# Altium schematic sheet Power.SchDoc
size Letter; SheetNumber: 3; SheetTotal: 7
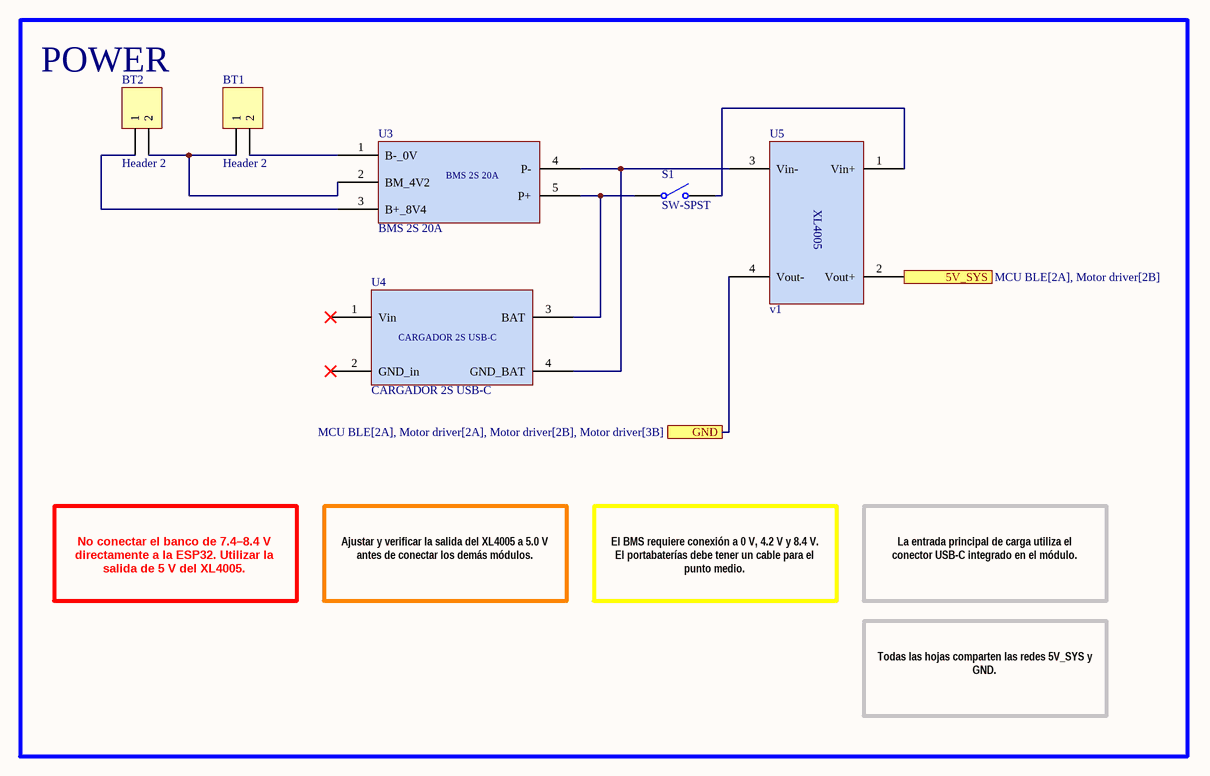
[diagram p0: Power.SchDoc]

## Parts
BT1  Header 2  [BORNERAS]
BT2  Header 2  [BORNERAS]
S1  SW-SPST  [BORNERAS]
U3  BMS 2S 20A  [BMS_2S_20A_HW391]
U4  CARGADOR 2S USB-C  [CARGADOR_2S_USBC]
U5  v1  [XL4005_MODULE]

## Blocks framed on the sheet
POWER: BT1 BT2 S1 U3-U5

## Ports
5V_SYS (see MCU BLE[2A], Motor driver[2B]), GND (see MCU BLE[2A], Motor driver[2A], Motor driver[2B], Motor driver[3B])

## Nets
5V_SYS: U5.2(Vout+) ; port 5V_SYS
GND: U5.4(Vout-) ; port GND
NetBT1_1: BT1.1 BT2.2 U3.2(BM_4V2)
NetBT1_2: BT1.2 U3.1(B-_0V)
NetBT2_1: BT2.1 U3.3(B+_8V4)
NetS1_1: S1.1(COMMON) U3.5(P+) U4.3(BAT)
NetS1_2: S1.2(NO) U5.1(Vin+)
NetU3_4: U3.4(P-) U4.4(GND_BAT) U5.3(Vin-)

Not connected (* = marked no-connect by the designer): U4 1(Vin)* 2(GND_in)*

## Notes on the sheet
- No conectar el banco de 7.4–8.4 V directamente a la ESP32. Utilizar la salida de 5 V del XL4005.
- Ajustar y verificar la salida del XL4005 a 5.0 V antes de conectar los demás módulos.
- El BMS requiere conexión a 0 V, 4.2 V y 8.4 V. El portabaterías debe tener un cable para el punto medio.
- La entrada principal de carga utiliza el conector USB-C integrado en el módulo.
- Todas las hojas comparten las redes 5V_SYS y GND.
- Proyecto:
- Autor:
- Carné:
- Documento:
- Curso:
- Revision:
- Fecha:
- Tamaño:
- Carta
- Hoja:      de
- (in symbol XL4005_MODULE) XL4005

## Library data of the parts
BT1 BT2 = Header 2: Header, 2-Pin; LatestRevisionDate: 17-Jul-2002; LatestRevisionNote: Re-released for DXP Platform.; Publisher: Altium Limited
S1 = SW-SPST: Single-Pole, Single-Throw Switch; Published: 24-Mar-1999; LatestRevisionDate: 17-Jul-2002; LatestRevisionNote: Re-released for DXP Platform.; PackageReference: SPST-2; Publisher: Altium Limited; PackageDescription: Switch; 2 Leads
U3 = BMS 2S 20A: BMS 2S 20A  v1.0
U4 = CARGADOR 2S USB-C: CARGADOR 2S USB-C v1.0
U5 = XL4005_MODULE